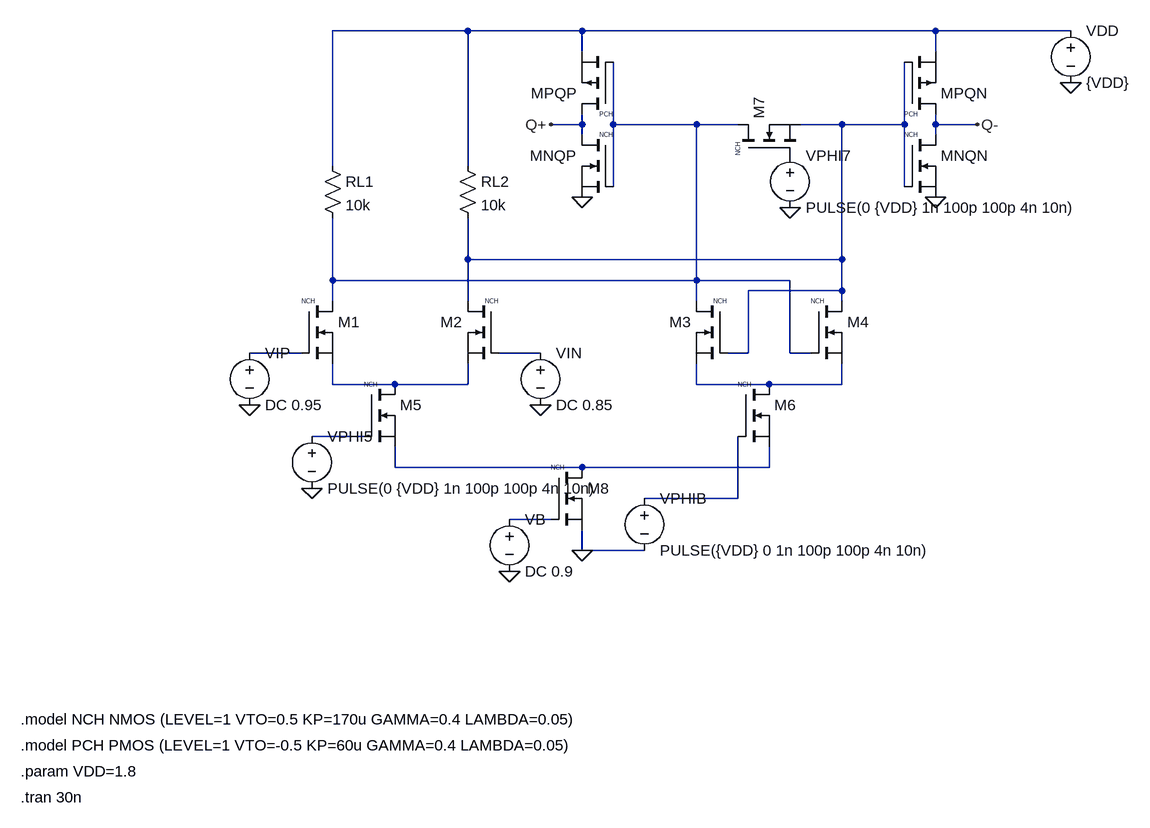
[diagram p0: schematic 3_current_steering_latch.asc]
3_current_steering_latch.asc, the LTspice schematic file:
Version 4
SHEET 1 3000 2000
WIRE 32 336 112 336
WIRE 128 464 208 464
WIRE 160 -160 160 48
WIRE 160 -160 368 -160
WIRE 160 128 160 224
WIRE 160 224 160 256
WIRE 160 224 720 224
WIRE 160 352 160 384
WIRE 160 384 256 384
WIRE 256 384 368 384
WIRE 256 480 256 512
WIRE 256 512 544 512
WIRE 368 -160 368 48
WIRE 368 -160 544 -160
WIRE 368 128 368 192
WIRE 368 192 368 256
WIRE 368 192 944 192
WIRE 368 352 368 384
WIRE 416 336 480 336
WIRE 432 592 496 592
WIRE 496 -16 544 -16
WIRE 544 -160 544 -128
WIRE 544 -160 1088 -160
WIRE 544 -32 544 -16
WIRE 544 -16 544 0
WIRE 544 512 832 512
WIRE 544 608 544 640
WIRE 544 640 640 640
WIRE 592 -112 592 -16
WIRE 592 -16 592 80
WIRE 592 -16 720 -16
WIRE 640 560 784 560
WIRE 720 -16 720 224
WIRE 720 -16 784 -16
WIRE 720 224 720 256
WIRE 720 224 864 224
WIRE 720 352 720 384
WIRE 720 384 832 384
WIRE 768 336 800 336
WIRE 784 464 784 560
WIRE 800 240 800 336
WIRE 800 240 944 240
WIRE 832 384 944 384
WIRE 832 480 832 512
WIRE 864 224 864 336
WIRE 864 336 896 336
WIRE 880 -16 944 -16
WIRE 944 -16 944 192
WIRE 944 -16 1040 -16
WIRE 944 192 944 240
WIRE 944 240 944 256
WIRE 944 352 944 384
WIRE 1040 -112 1040 -16
WIRE 1040 -16 1040 80
WIRE 1088 -160 1088 -128
WIRE 1088 -160 1296 -160
WIRE 1088 -32 1088 -16
WIRE 1088 -16 1088 0
WIRE 1088 -16 1152 -16
FLAG 1296 -80 0
FLAG 864 112 0
FLAG 544 96 0
FLAG 496 -16 Q+
FLAG 1088 96 0
FLAG 1152 -16 Q-
FLAG 32 416 0
FLAG 480 416 0
FLAG 128 544 0
FLAG 432 672 0
FLAG 544 640 0
SYMBOL voltage 1296 -176 R0
SYMATTR InstName VDD
SYMATTR Value {VDD}
SYMBOL res 144 32 R0
SYMATTR InstName RL1
SYMATTR Value 10k
SYMBOL res 352 32 R0
SYMATTR InstName RL2
SYMATTR Value 10k
SYMBOL nmos 112 256 R0
WINDOW 3 0 0 Left 0
WINDOW 123 0 0 Left 0
SYMATTR InstName M1
SYMATTR Value NCH
SYMATTR SpiceLine l=0.18u w=2u
SYMBOL nmos 416 256 M0
WINDOW 3 0 0 Left 0
WINDOW 123 0 0 Left 0
SYMATTR InstName M2
SYMATTR Value NCH
SYMATTR SpiceLine l=0.18u w=2u
SYMBOL nmos 768 256 M0
WINDOW 3 0 0 Left 0
WINDOW 123 0 0 Left 0
SYMATTR InstName M3
SYMATTR Value NCH
SYMATTR SpiceLine l=0.18u w=2u
SYMBOL nmos 896 256 R0
WINDOW 3 0 0 Left 0
WINDOW 123 0 0 Left 0
SYMATTR InstName M4
SYMATTR Value NCH
SYMATTR SpiceLine l=0.18u w=2u
SYMBOL nmos 784 32 R270
WINDOW 3 0 0 Left 0
WINDOW 123 0 0 Left 0
SYMATTR InstName M7
SYMATTR Value NCH
SYMATTR SpiceLine l=0.18u w=2u
SYMBOL voltage 864 16 R0
SYMATTR InstName VPHI7
SYMATTR Value PULSE(0 {VDD} 1n 100p 100p 4n 10n)
SYMBOL pmos 592 -32 R180
WINDOW 3 0 0 Left 0
WINDOW 123 0 0 Left 0
SYMATTR InstName MPQP
SYMATTR Value PCH
SYMATTR SpiceLine l=0.18u w=4u
SYMBOL nmos 592 0 M0
WINDOW 3 0 0 Left 0
WINDOW 123 0 0 Left 0
SYMATTR InstName MNQP
SYMATTR Value NCH
SYMATTR SpiceLine l=0.18u w=2u
SYMBOL pmos 1040 -32 M180
WINDOW 3 0 0 Left 0
WINDOW 123 0 0 Left 0
SYMATTR InstName MPQN
SYMATTR Value PCH
SYMATTR SpiceLine l=0.18u w=4u
SYMBOL nmos 1040 0 R0
WINDOW 3 0 0 Left 0
WINDOW 123 0 0 Left 0
SYMATTR InstName MNQN
SYMATTR Value NCH
SYMATTR SpiceLine l=0.18u w=2u
SYMBOL voltage 32 320 R0
SYMATTR InstName VIP
SYMATTR Value DC 0.95
SYMBOL voltage 480 320 R0
SYMATTR InstName VIN
SYMATTR Value DC 0.85
SYMBOL nmos 208 384 R0
WINDOW 3 0 0 Left 0
WINDOW 123 0 0 Left 0
SYMATTR InstName M5
SYMATTR Value NCH
SYMATTR SpiceLine l=0.18u w=2u
SYMBOL nmos 784 384 R0
WINDOW 3 0 0 Left 0
WINDOW 123 0 0 Left 0
SYMATTR InstName M6
SYMATTR Value NCH
SYMATTR SpiceLine l=0.18u w=2u
SYMBOL voltage 128 448 R0
SYMATTR InstName VPHI5
SYMATTR Value PULSE(0 {VDD} 1n 100p 100p 4n 10n)
SYMBOL voltage 640 544 R0
SYMATTR InstName VPHIB
SYMATTR Value PULSE({VDD} 0 1n 100p 100p 4n 10n)
SYMBOL nmos 496 512 R0
WINDOW 3 0 0 Left 0
WINDOW 123 0 0 Left 0
SYMATTR InstName M8
SYMATTR Value NCH
SYMATTR SpiceLine l=0.18u w=2u
SYMBOL voltage 432 576 R0
SYMATTR InstName VB
SYMATTR Value DC 0.9
TEXT -320 900 Left 2 !.model NCH NMOS (LEVEL=1 VTO=0.5 KP=170u GAMMA=0.4 LAMBDA=0.05)
TEXT -320 940 Left 2 !.model PCH PMOS (LEVEL=1 VTO=-0.5 KP=60u GAMMA=0.4 LAMBDA=0.05)
TEXT -320 980 Left 2 !.param VDD=1.8
TEXT -320 1020 Left 2 !.tran 30n

The netlist it stands for:
* 3_current_steering_latch.asc
VDD N003 0 {VDD}
RL1 N003 N004 10k
RL2 N003 N007 10k
M1 N004 N001 N005 N005 NCH l=0.18u w=2u
M2 N007 N008 N005 N005 NCH l=0.18u w=2u
M3 N004 N007 N011 N011 NCH l=0.18u w=2u
M4 N007 N004 N011 N011 NCH l=0.18u w=2u
M7 N004 P001 N007 N007 NCH l=0.18u w=2u
VPHI7 P001 0 PULSE(0 {VDD} 1n 100p 100p 4n 10n)
MPQP Q+ N004 N003 N003 PCH l=0.18u w=4u
MNQP Q+ N004 0 0 NCH l=0.18u w=2u
MPQN Q- N007 N003 N003 PCH l=0.18u w=4u
MNQN Q- N007 0 0 NCH l=0.18u w=2u
VIP N001 0 DC 0.95
VIN N008 0 DC 0.85
M5 N005 N002 N006 N006 NCH l=0.18u w=2u
M6 N011 N010 N006 N006 NCH l=0.18u w=2u
VPHI5 N002 0 PULSE(0 {VDD} 1n 100p 100p 4n 10n)
VPHIB N010 0 PULSE({VDD} 0 1n 100p 100p 4n 10n)
M8 N006 N009 0 0 NCH l=0.18u w=2u
VB N009 0 DC 0.9
.model NMOS NMOS
.model PMOS PMOS
.lib standard.mos
.model NCH NMOS (LEVEL=1 VTO=0.5 KP=170u GAMMA=0.4 LAMBDA=0.05)
.model PCH PMOS (LEVEL=1 VTO=-0.5 KP=60u GAMMA=0.4 LAMBDA=0.05)
.param VDD=1.8
.tran 30n
.backanno
.end